# EAGLE design msx_slot_expander (EAGLE 7.6.0)

## Sheet 1 of 2
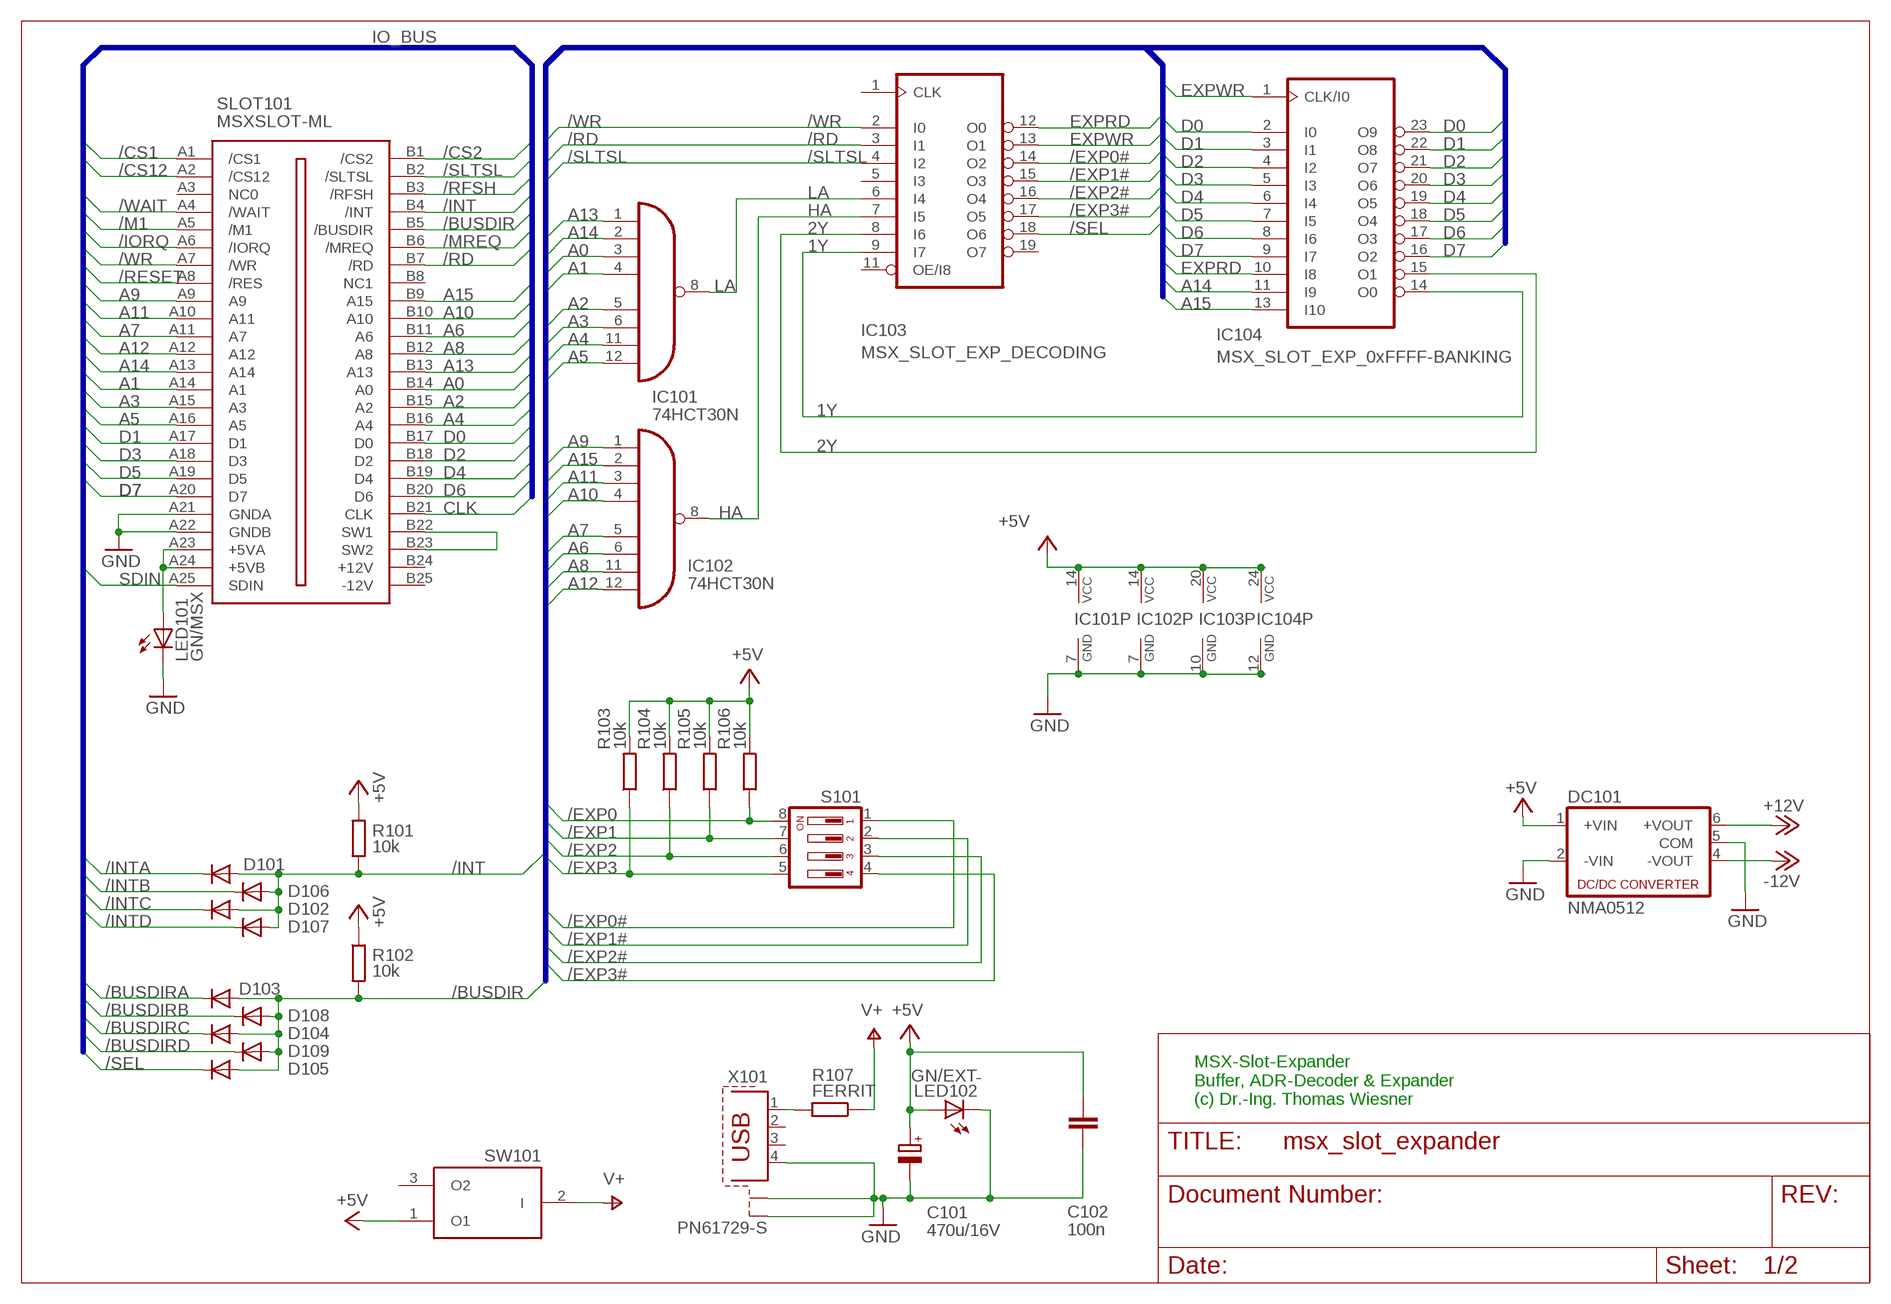
[diagram p0: schematic, sheet 1]

### Parts
C101  470u/16V  CPOL-EUE3.5-8  [E3,5-8]
C102  100n  C-EU025-025X050  [C025-025X050]
D101  1N4148  1N4148DO35-10  [DO35-10]
D102  1N4148  1N4148DO35-10  [DO35-10]
D103  1N4148  1N4148DO35-10  [DO35-10]
D104  1N4148  1N4148DO35-10  [DO35-10]
D105  1N4148  1N4148DO35-10  [DO35-10]
D106  1N4148  1N4148DO35-10  [DO35-10]
D107  1N4148  1N4148DO35-10  [DO35-10]
D108  1N4148  1N4148DO35-10  [DO35-10]
D109  1N4148  1N4148DO35-10  [DO35-10]
DC101  NMA0512  NMA  [NMA]
IC101  74HCT30N  [DIL14]
IC102  74HCT30N  [DIL14]
IC103  MSX_SLOT_EXP_DECODING  16V8  [DIL20]
IC104  MSX_SLOT_EXP_0xFFFF-BANKING  22V10  [DIL24-3]
LED101  GN/MSX  LED3MM  [LED3MM]
LED102  GN/EXT  LED3MM  [LED3MM]
R101  10k  R-EU_0207/10  [0207/10]
R102  10k  R-EU_0207/10  [0207/10]
R103  10k  R-EU_0207/10  [0207/10]
R104  10k  R-EU_0207/10  [0207/10]
R105  10k  R-EU_0207/10  [0207/10]
R106  10k  R-EU_0207/10  [0207/10]
R107  FERRIT  R-EU_0207/10  [0207/10]
S101  DA04  [DA-04]
SLOT101  MSXSLOT-ML  [MSXSLOT-ML]
SW101  TS-13PA  [TS-13-P]
X101  PN61729-S  [PN61729-S]

### Nets
1Y: IC103.9(I7) IC104.14(O0)
2Y: IC103.8(I6) IC104.15(O1)
+5V: C101.+ C102.2 DC101.1(+VIN) IC101.14(VCC) IC102.14(VCC) IC103.20(VCC) IC104.24(VCC) LED102.A R101.2 R102.1 R103.2 R104.2 R105.2 R106.2 SW101.1(O1) ; also sheet 2
+12V: DC101.6(+VOUT) ; also sheet 2
-12V: DC101.4(-VOUT) ; also sheet 2
/BUSDIR: D103.A D104.A D105.A D108.A D109.A R102.2 SLOT101.B5(/BUSDIR)
/BUSDIRA: D103.C ; also sheet 2
/BUSDIRB: D108.C ; also sheet 2
/BUSDIRC: D104.C ; also sheet 2
/BUSDIRD: D109.C ; also sheet 2
/CS1: SLOT101.A1(/CS1) ; also sheet 2
/CS2: SLOT101.B1(/CS2) ; also sheet 2
/CS12: SLOT101.A2(/CS12) ; also sheet 2
/EXP0: R106.1 S101.8 ; also sheet 2
/EXP0#: IC103.14(O2) S101.1
/EXP1: R105.1 S101.7 ; also sheet 2
/EXP1#: IC103.15(O3) S101.2
/EXP2: R104.1 S101.6 ; also sheet 2
/EXP2#: IC103.16(O4) S101.3
/EXP3: R103.1 S101.5 ; also sheet 2
/EXP3#: IC103.17(O5) S101.4
/INT: D101.A D102.A D106.A D107.A R101.1 SLOT101.B4(/INT)
/INTA: D101.C ; also sheet 2
/INTB: D106.C ; also sheet 2
/INTC: D102.C ; also sheet 2
/INTD: D107.C ; also sheet 2
/IORQ: SLOT101.A6(/IORQ) ; also sheet 2
/M1: SLOT101.A5(/M1) ; also sheet 2
/MREQ: SLOT101.B6(/MREQ) ; also sheet 2
/RD: IC103.3(I1) SLOT101.B7(/RD) ; also sheet 2
/RESET: SLOT101.A8(/RES) ; also sheet 2
/RFSH: SLOT101.B3(/RFSH) ; also sheet 2
/SEL: D105.C IC103.18(O6)
/SLTSL: IC103.4(I2) SLOT101.B2(/SLTSL)
/WAIT: SLOT101.A4(/WAIT) ; also sheet 2
/WR: IC103.2(I0) SLOT101.A7(/WR) ; also sheet 2
A0: IC101.3(I2) SLOT101.B14(A0) ; also sheet 2
A1: IC101.4(I3) SLOT101.A14(A1) ; also sheet 2
A2: IC101.5(I4) SLOT101.B15(A2) ; also sheet 2
A3: IC101.6(I5) SLOT101.A15(A3) ; also sheet 2
A4: IC101.11(I6) SLOT101.B16(A4) ; also sheet 2
A5: IC101.12(I7) SLOT101.A16(A5) ; also sheet 2
A6: IC102.6(I5) SLOT101.B11(A6) ; also sheet 2
A7: IC102.5(I4) SLOT101.A11(A7) ; also sheet 2
A8: IC102.11(I6) SLOT101.B12(A8) ; also sheet 2
A9: IC102.1(I0) SLOT101.A9 ; also sheet 2
A10: IC102.4(I3) SLOT101.B10(A10) ; also sheet 2
A11: IC102.3(I2) SLOT101.A10(A11) ; also sheet 2
A12: IC102.12(I7) SLOT101.A12 ; also sheet 2
A13: IC101.1(I0) SLOT101.B13(A13) ; also sheet 2
A14: IC101.2(I1) IC104.11(I9) SLOT101.A13(A14) ; also sheet 2
A15: IC102.2(I1) IC104.13(I10) SLOT101.B9(A15) ; also sheet 2
CLK: SLOT101.B21(CLK) ; also sheet 2
D0: IC104.2(I0) IC104.23(O9) SLOT101.B17(D0) ; also sheet 2
D1: IC104.3(I1) IC104.22(O8) SLOT101.A17(D1) ; also sheet 2
D2: IC104.4(I2) IC104.21(O7) SLOT101.B18(D2) ; also sheet 2
D3: IC104.5(I3) IC104.20(O6) SLOT101.A18(D3) ; also sheet 2
D4: IC104.6(I4) IC104.19(O5) SLOT101.B19(D4) ; also sheet 2
D5: IC104.7(I5) IC104.18(O4) SLOT101.A19(D5) ; also sheet 2
D6: IC104.8(I6) IC104.17(O3) SLOT101.B20(D6) ; also sheet 2
D7: IC104.9(I7) IC104.16(O2) SLOT101.A20(D7) ; also sheet 2
EXPRD: IC103.12(O0) IC104.10(I8)
EXPWR: IC103.13(O1) IC104.1(CLK/I0)
GND: C101.- C102.1 DC101.2(-VIN) DC101.5(COM) IC101.7(GND) IC102.7(GND) IC103.10(GND) IC104.12(GND) LED101.K(C) LED102.K(C) SLOT101.A21(GNDA) SLOT101.A22(GNDB) X101.4 X101.S1 X101.S2 ; also sheet 2
HA: IC102.8(O) IC103.7(I5)
LA: IC101.8(O) IC103.6(I4)
N$1: LED101.A SLOT101.A23(+5VA) SLOT101.A24(+5VB)
N$2: R107.2 X101.1
N$3: SLOT101.B22(SW1) SLOT101.B23(SW2)
SDIN: SLOT101.A25(SDIN) ; also sheet 2
V+: R107.1 SW101.2(I)
Unconnected: IC103.1(CLK) IC103.5(I3) IC103.11(OE/I8) IC103.19(O7) SLOT101.A3(NC0) SLOT101.B8(NC1) SLOT101.B24(+12V) SLOT101.B25(-12V) SW101.3(O2) X101.2 X101.3

### Buses
IO_BUS
B$5

### Notes on the sheet
- MSX-Slot-Expander
  Buffer, ADR-Decoder & Expander
  (c) Dr.-Ing. Thomas Wiesner

## Sheet 2 of 2
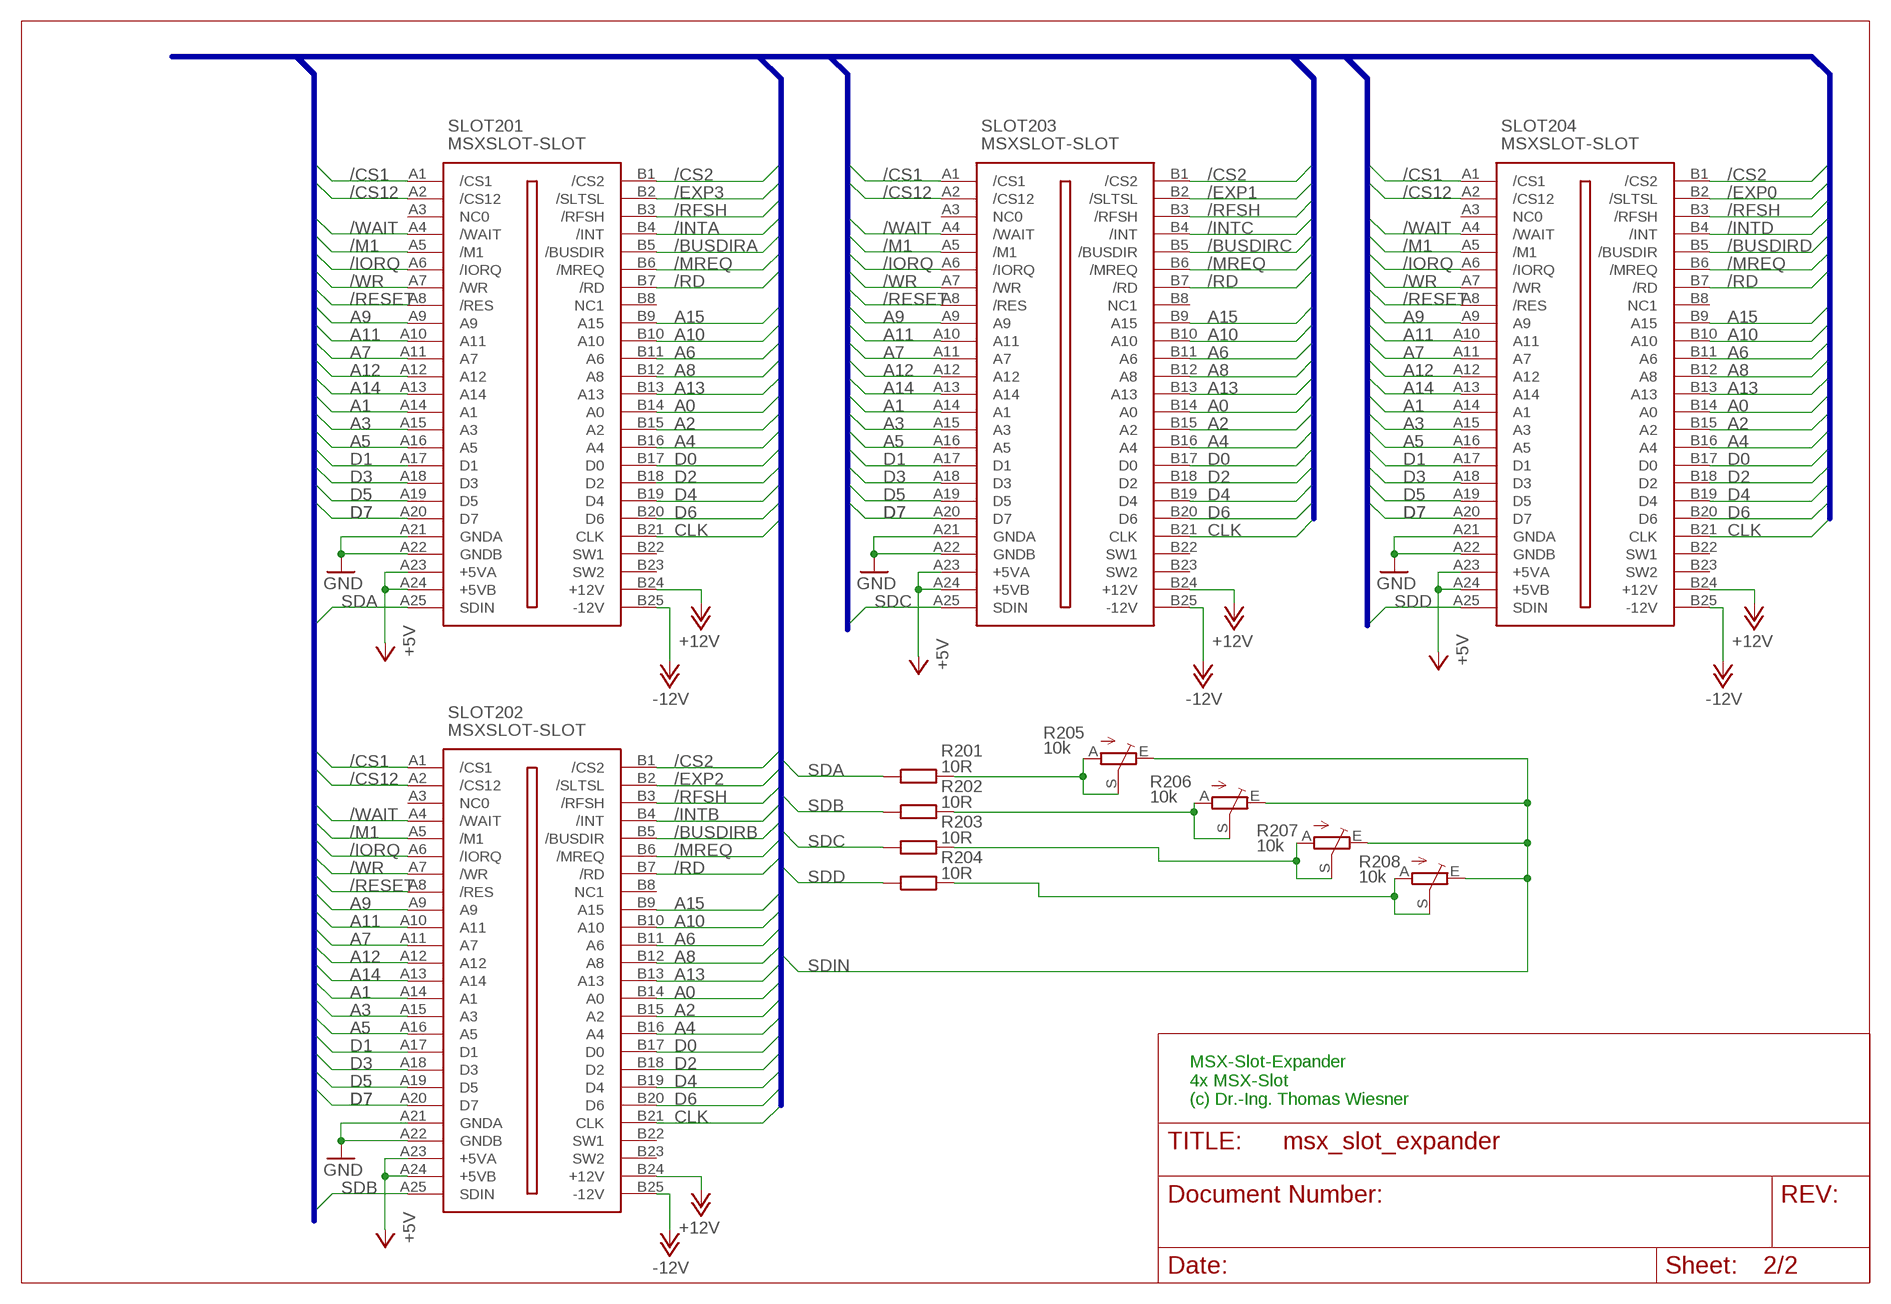
[diagram p1: schematic, sheet 2]

### Parts
R201  10R  R-EU_0207/10  [0207/10]
R202  10R  R-EU_0207/10  [0207/10]
R203  10R  R-EU_0207/10  [0207/10]
R204  10R  R-EU_0207/10  [0207/10]
R205  10k  TRIM_EU-S43P  [SP19L]
R206  10k  TRIM_EU-S43P  [SP19L]
R207  10k  TRIM_EU-S43P  [SP19L]
R208  10k  TRIM_EU-S43P  [SP19L]
SLOT201  MSXSLOT-SLOT  [MSXSLOT]
SLOT202  MSXSLOT-SLOT  [MSXSLOT]
SLOT203  MSXSLOT-SLOT  [MSXSLOT]
SLOT204  MSXSLOT-SLOT  [MSXSLOT]

### Nets
+5V: SLOT201.A23(+5VA) SLOT201.A24(+5VB) SLOT202.A23(+5VA) SLOT202.A24(+5VB) SLOT203.A23(+5VA) SLOT203.A24(+5VB) SLOT204.A23(+5VA) SLOT204.A24(+5VB) ; also sheet 1
+12V: SLOT201.B24(+12V) SLOT202.B24(+12V) SLOT203.B24(+12V) SLOT204.B24(+12V) ; also sheet 1
-12V: SLOT201.B25(-12V) SLOT202.B25(-12V) SLOT203.B25(-12V) SLOT204.B25(-12V) ; also sheet 1
/BUSDIRA: SLOT201.B5(/BUSDIR) ; also sheet 1
/BUSDIRB: SLOT202.B5(/BUSDIR) ; also sheet 1
/BUSDIRC: SLOT203.B5(/BUSDIR) ; also sheet 1
/BUSDIRD: SLOT204.B5(/BUSDIR) ; also sheet 1
/CS1: SLOT201.A1(/CS1) SLOT202.A1(/CS1) SLOT203.A1(/CS1) SLOT204.A1(/CS1) ; also sheet 1
/CS2: SLOT201.B1(/CS2) SLOT202.B1(/CS2) SLOT203.B1(/CS2) SLOT204.B1(/CS2) ; also sheet 1
/CS12: SLOT201.A2(/CS12) SLOT202.A2(/CS12) SLOT203.A2(/CS12) SLOT204.A2(/CS12) ; also sheet 1
/EXP0: SLOT204.B2(/SLTSL) ; also sheet 1
/EXP1: SLOT203.B2(/SLTSL) ; also sheet 1
/EXP2: SLOT202.B2(/SLTSL) ; also sheet 1
/EXP3: SLOT201.B2(/SLTSL) ; also sheet 1
/INTA: SLOT201.B4(/INT) ; also sheet 1
/INTB: SLOT202.B4(/INT) ; also sheet 1
/INTC: SLOT203.B4(/INT) ; also sheet 1
/INTD: SLOT204.B4(/INT) ; also sheet 1
/IORQ: SLOT201.A6(/IORQ) SLOT202.A6(/IORQ) SLOT203.A6(/IORQ) SLOT204.A6(/IORQ) ; also sheet 1
/M1: SLOT201.A5(/M1) SLOT202.A5(/M1) SLOT203.A5(/M1) SLOT204.A5(/M1) ; also sheet 1
/MREQ: SLOT201.B6(/MREQ) SLOT202.B6(/MREQ) SLOT203.B6(/MREQ) SLOT204.B6(/MREQ) ; also sheet 1
/RD: SLOT201.B7(/RD) SLOT202.B7(/RD) SLOT203.B7(/RD) SLOT204.B7(/RD) ; also sheet 1
/RESET: SLOT201.A8(/RES) SLOT202.A8(/RES) SLOT203.A8(/RES) SLOT204.A8(/RES) ; also sheet 1
/RFSH: SLOT201.B3(/RFSH) SLOT202.B3(/RFSH) SLOT203.B3(/RFSH) SLOT204.B3(/RFSH) ; also sheet 1
/WAIT: SLOT201.A4(/WAIT) SLOT202.A4(/WAIT) SLOT203.A4(/WAIT) SLOT204.A4(/WAIT) ; also sheet 1
/WR: SLOT201.A7(/WR) SLOT202.A7(/WR) SLOT203.A7(/WR) SLOT204.A7(/WR) ; also sheet 1
A0: SLOT201.B14(A0) SLOT202.B14(A0) SLOT203.B14(A0) SLOT204.B14(A0) ; also sheet 1
A1: SLOT201.A14(A1) SLOT202.A14(A1) SLOT203.A14(A1) SLOT204.A14(A1) ; also sheet 1
A2: SLOT201.B15(A2) SLOT202.B15(A2) SLOT203.B15(A2) SLOT204.B15(A2) ; also sheet 1
A3: SLOT201.A15(A3) SLOT202.A15(A3) SLOT203.A15(A3) SLOT204.A15(A3) ; also sheet 1
A4: SLOT201.B16(A4) SLOT202.B16(A4) SLOT203.B16(A4) SLOT204.B16(A4) ; also sheet 1
A5: SLOT201.A16(A5) SLOT202.A16(A5) SLOT203.A16(A5) SLOT204.A16(A5) ; also sheet 1
A6: SLOT201.B11(A6) SLOT202.B11(A6) SLOT203.B11(A6) SLOT204.B11(A6) ; also sheet 1
A7: SLOT201.A11(A7) SLOT202.A11(A7) SLOT203.A11(A7) SLOT204.A11(A7) ; also sheet 1
A8: SLOT201.B12(A8) SLOT202.B12(A8) SLOT203.B12(A8) SLOT204.B12(A8) ; also sheet 1
A9: SLOT201.A9 SLOT202.A9 SLOT203.A9 SLOT204.A9 ; also sheet 1
A10: SLOT201.B10(A10) SLOT202.B10(A10) SLOT203.B10(A10) SLOT204.B10(A10) ; also sheet 1
A11: SLOT201.A10(A11) SLOT202.A10(A11) SLOT203.A10(A11) SLOT204.A10(A11) ; also sheet 1
A12: SLOT201.A12 SLOT202.A12 SLOT203.A12 SLOT204.A12 ; also sheet 1
A13: SLOT201.B13(A13) SLOT202.B13(A13) SLOT203.B13(A13) SLOT204.B13(A13) ; also sheet 1
A14: SLOT201.A13(A14) SLOT202.A13(A14) SLOT203.A13(A14) SLOT204.A13(A14) ; also sheet 1
A15: SLOT201.B9(A15) SLOT202.B9(A15) SLOT203.B9(A15) SLOT204.B9(A15) ; also sheet 1
CLK: SLOT201.B21(CLK) SLOT202.B21(CLK) SLOT203.B21(CLK) SLOT204.B21(CLK) ; also sheet 1
D0: SLOT201.B17(D0) SLOT202.B17(D0) SLOT203.B17(D0) SLOT204.B17(D0) ; also sheet 1
D1: SLOT201.A17(D1) SLOT202.A17(D1) SLOT203.A17(D1) SLOT204.A17(D1) ; also sheet 1
D2: SLOT201.B18(D2) SLOT202.B18(D2) SLOT203.B18(D2) SLOT204.B18(D2) ; also sheet 1
D3: SLOT201.A18(D3) SLOT202.A18(D3) SLOT203.A18(D3) SLOT204.A18(D3) ; also sheet 1
D4: SLOT201.B19(D4) SLOT202.B19(D4) SLOT203.B19(D4) SLOT204.B19(D4) ; also sheet 1
D5: SLOT201.A19(D5) SLOT202.A19(D5) SLOT203.A19(D5) SLOT204.A19(D5) ; also sheet 1
D6: SLOT201.B20(D6) SLOT202.B20(D6) SLOT203.B20(D6) SLOT204.B20(D6) ; also sheet 1
D7: SLOT201.A20(D7) SLOT202.A20(D7) SLOT203.A20(D7) SLOT204.A20(D7) ; also sheet 1
GND: SLOT201.A21(GNDA) SLOT201.A22(GNDB) SLOT202.A21(GNDA) SLOT202.A22(GNDB) SLOT203.A21(GNDA) SLOT203.A22(GNDB) SLOT204.A21(GNDA) SLOT204.A22(GNDB) ; also sheet 1
N$4: R201.2 R205.A R205.S
N$9: R202.2 R206.A R206.S
N$10: R203.2 R207.A R207.S
N$15: R204.2 R208.A R208.S
SDA: R201.1 SLOT201.A25(SDIN)
SDB: R202.1 SLOT202.A25(SDIN)
SDC: R203.1 SLOT203.A25(SDIN)
SDD: R204.1 SLOT204.A25(SDIN)
SDIN: R205.E R206.E R207.E R208.E ; also sheet 1
Unconnected: SLOT201.A3(NC0) SLOT201.B8(NC1) SLOT201.B22(SW1) SLOT201.B23(SW2) SLOT202.A3(NC0) SLOT202.B8(NC1) SLOT202.B22(SW1) SLOT202.B23(SW2) SLOT203.A3(NC0) SLOT203.B8(NC1) SLOT203.B22(SW1) SLOT203.B23(SW2) SLOT204.A3(NC0) SLOT204.B8(NC1) SLOT204.B22(SW1) SLOT204.B23(SW2)

### Buses
B$5

### Notes on the sheet
- MSX-Slot-Expander
  4x MSX-Slot
  (c) Dr.-Ing. Thomas Wiesner

## Library data of the parts
C101 = rcl:CPOL-EU: POLARIZED CAPACITOR, European symbol
C102 = rcl:C-EU: CAPACITOR, European symbol
D101-D109 = diode:1N4148: DIODE high speed (Philips)
DC101 = dc-dc-converter:NMA: DC-DC CONVERTER; MF: C & D TECHNOLOGIES, INC; MPN: NMA0515SC; OC_FARNELL: 1021434; OC_NEWARK: 61K3064
IC101 IC102 = 74xx-eu:74*30: 8-input NAND gate
IC103 = pal:16V8: PAL; MPN: GAL16V8D-7LPN; OC_FARNELL: 9699740; OC_NEWARK: 97K0449
IC104 = pal:22V10: PAL; MPN: GAL22V10D-7LPN; OC_FARNELL: 1571925; OC_NEWARK: 97M0480
LED101 LED102 = led:LED: LED OSRAM: - CHIPLED LG R971, LG N971, LY N971, LG Q971, LY Q971, LO R971, LY R971 LH N974, LH R974 LS Q976, LO Q976, LY Q976 LO Q996 - Hyper CHIPLED LW Q18S LB Q993, LB Q99A, LB R99A - SideLED LS A670, LO A670, LY A670, LG A670, LP A670 LB A673, LV A673, LT A673, LW A673 LH A674 LY A675 LS A676, LA A676, LO A676, LY A676, LW A676 LS A679, LY A679, LG A679 - Hyper Micro SIDELED® LS Y876, LA Y876, LO Y876, LY Y876 LT Y87S - SmartLED LW L88C, LW L88S LB L89C, LB L89S, LG L890 LS L89K, LO L89K, LY L89K LS L896, LA L896, LO L896, LY L896 - TOPLED LS T670, LO T670, LY T670, LG T670, LP T670 LSG T670, LSP T670, LSY T670, LOP T670, LYG T670 LG T671, LOG T671, LSG T671 LB T673, LV T673, LT T673, LW T673 LH T674 LS T676, LA T676, LO T676, LY T676, LB T676, LH T676, LSB T676, LW T676 LB T67C, LV T67C, LT T67C, LS T67K, LO T67K, LY T67K, LW E67C LS E67B, LA E67B, LO E67B, LY E67B, LB E67C, LV E67C, LT E67C LW T67C LS T679, LY T679, LG T679 LS T770, LO T770, LY T770, LG T770, LP T770 LB T773, LV T773, LT T773, LW T773 LH T774 LS E675, LA E675, LY E675, LS T675 LS T776, LA T776, LO T776, LY T776, LB T776 LHGB T686 LT T68C, LB T68C - Hyper Mini TOPLED® LB M676 - Mini TOPLED Santana® LG M470 LS M47K, LO M47K, LY M47K Source: http://www.osram.convergy.de LUXEON: - LUMILED® LXK2-PW12-R00, LXK2-PW12-S00, LXK2-PW14-U00, LXK2-PW14-V00 LXK2-PM12-R00, LXK2-PM12-S00, LXK2-PM14-U00 LXK2-PE12-Q00, LXK2-PE12-R00, LXK2-PE12-S00, LXK2-PE14-T00, LXK2-PE14-U00 LXK2-PB12-K00, LXK2-PB12-L00, LXK2-PB12-M00, LXK2-PB14-N00, LXK2-PB14-P00, LXK2-PB14-Q00 LXK2-PR12-L00, LXK2-PR12-M00, LXK2-PR14-Q00, LXK2-PR14-R00 LXK2-PD12-Q00, LXK2-PD12-R00, LXK2-PD12-S00 LXK2-PH12-R00, LXK2-PH12-S00 LXK2-PL12-P00, LXK2-PL12-Q00, LXK2-PL12-R00 Source: www.luxeon.com KINGBRIGHT: KA-3528ASYC Source: www.kingbright.com
R101-R107 R201-R204 = resistor:R-EU_: RESISTOR, European symbol
R205-R208 = pot:TRIM_EU-: POTENTIOMETER
S101 = switch-dil:DA04: DIL/CODE SWITCH; MPN: MCDA04; OC_FARNELL: 9471545; OC_NEWARK: 26M1090
SLOT101 SLOT201-SLOT204 = mbc:MSXSLOT: MSX-Slot-Verbinder
SW101 = mbc:TS-13P: TS-13P - Umschalter liegend Printmontage
X101 = con-berg:PN61729-S: BERG USB connector; OC_FARNELL: unknown; OC_NEWARK: unknown

## Board
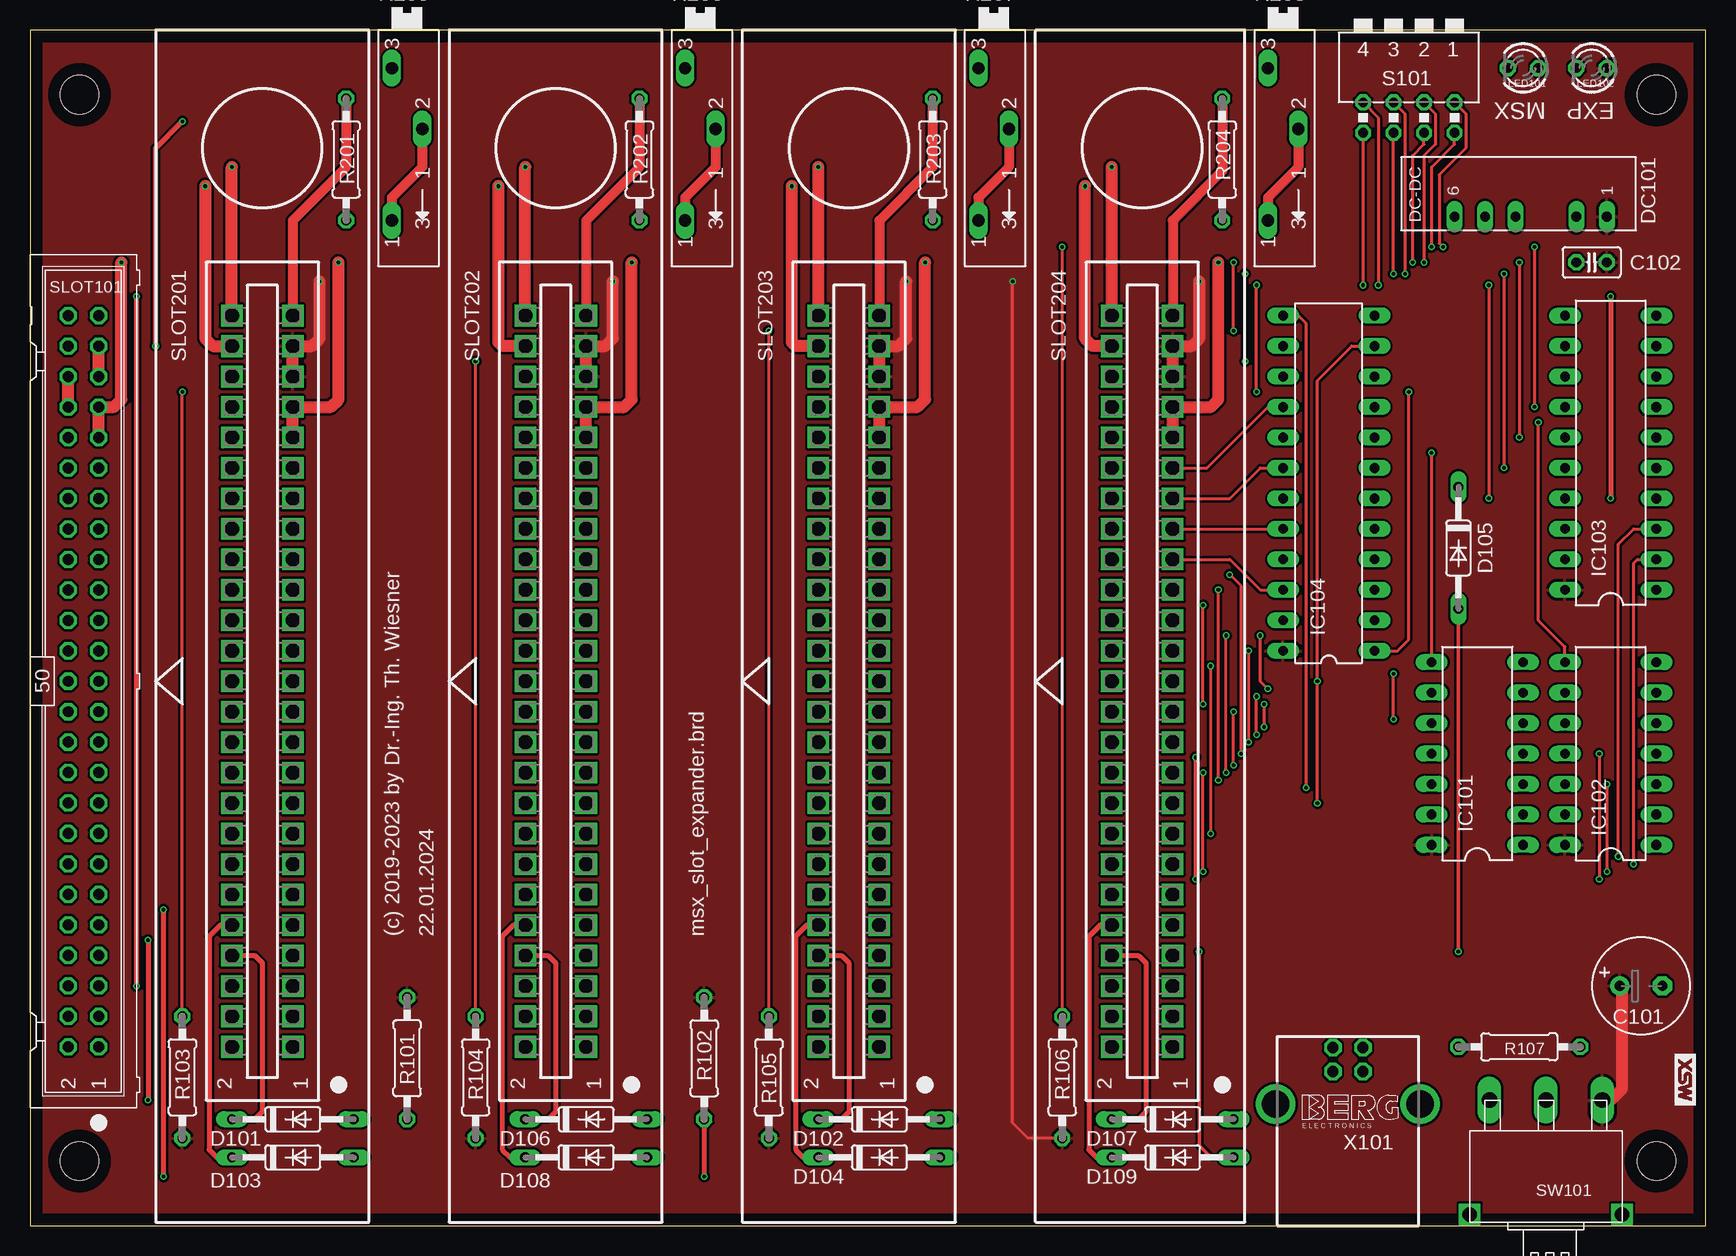
[diagram p2: board, top side]
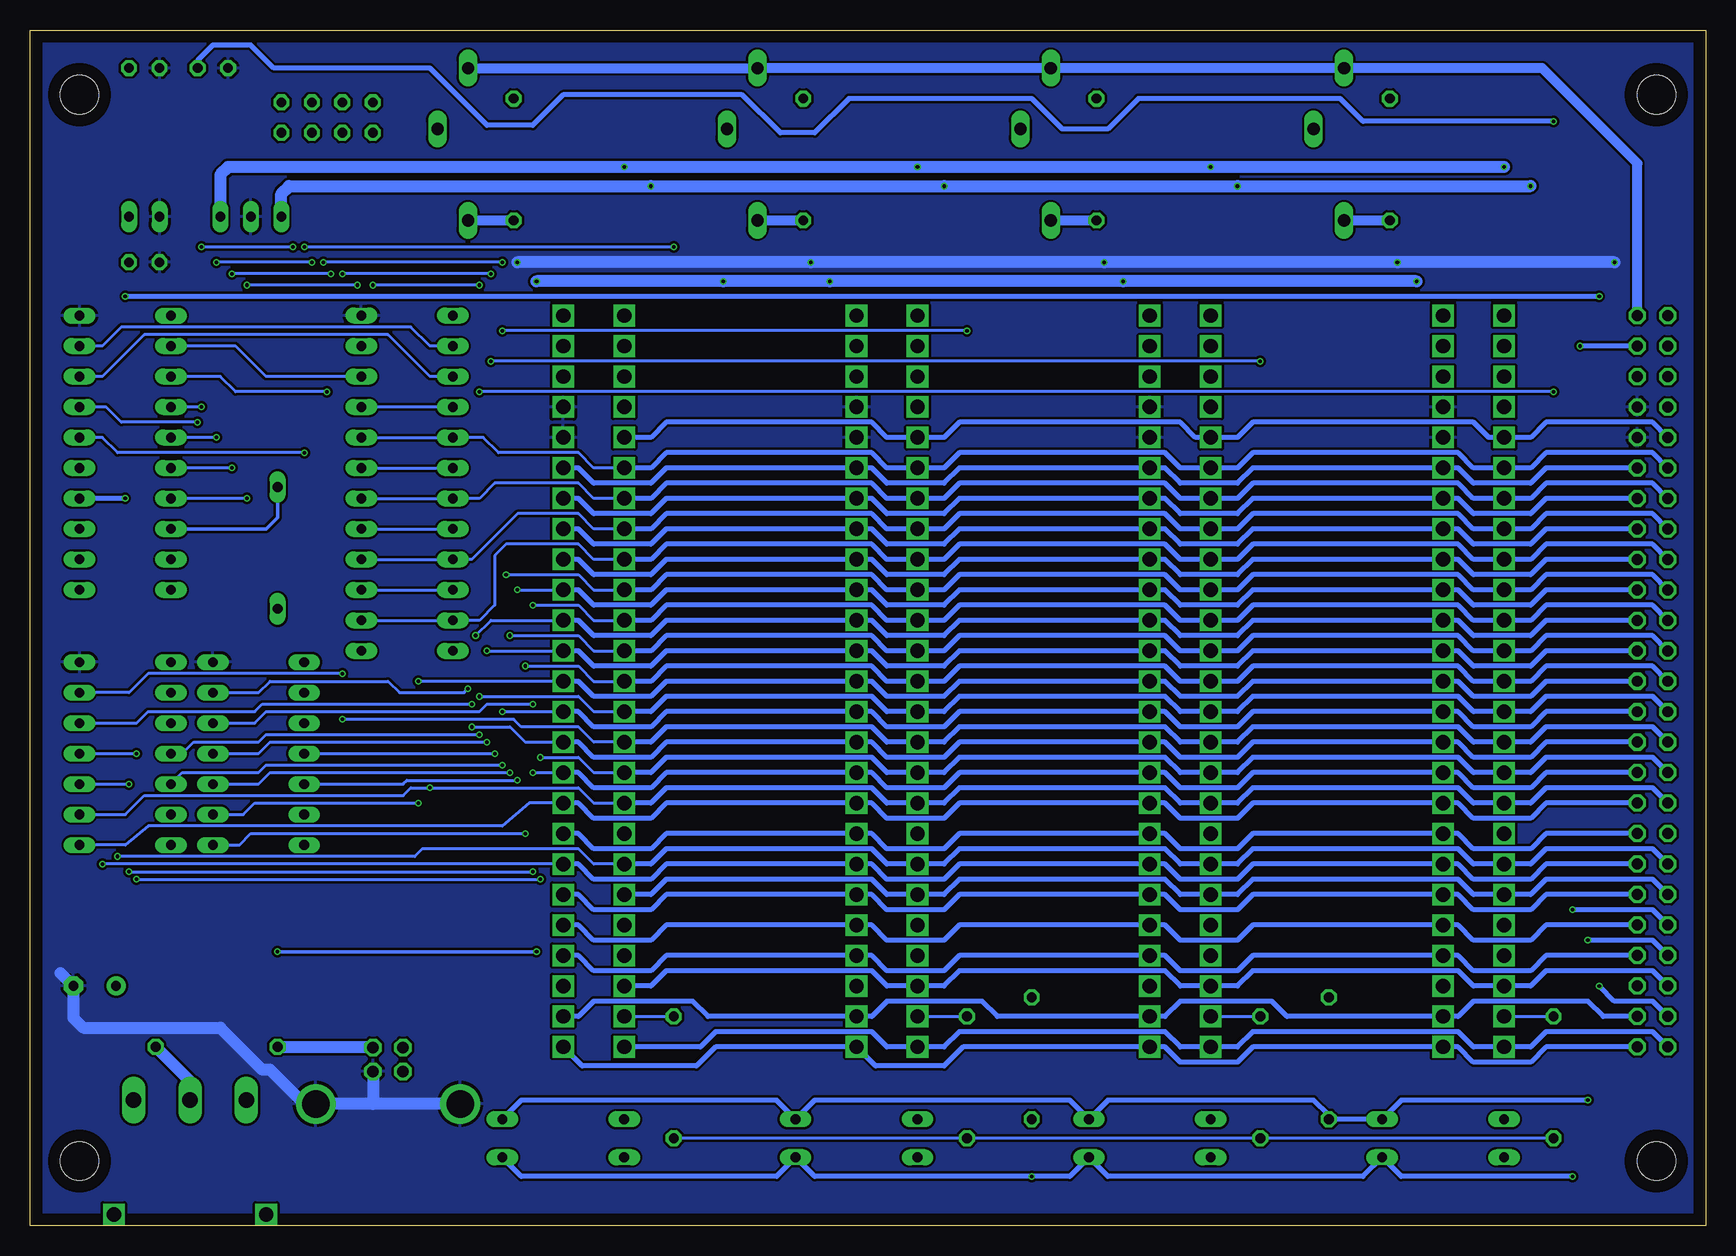
[diagram p3: board, bottom side, seen from below]

Size 139.7 x 99.69 mm. Coordinates in mm from the lower left corner, seen from the top.
Outline: 0,0 139.7,0 139.7,99.69 0,99.69 0,0
Copper layers (1*16): Top 0.035mm / dielectric 1.5mm / Bottom 0.035mm
Design rules "default *": minimum track width 10mil, minimum drill 0.3mm, track to track 8mil, track to pad 4mil, pad to pad 8mil, via to via 8mil, smd to smd 8mil, copper to edge 40mil, drill to drill 8mil, minimum pad ring 10mil, minimum via ring 0.125mm, stop-mask expansion 4mil, vias tented up to drill 0mil, thermal gap 10mil
Holes 3.2 mm at 135.57,5.4 135.57,94.3 4.13,94.3 4.13,5.4

### Footprints (pad centres in the part's own frame; a part is rotated, then mirrored left to right if it is on the bottom)
E3,5-8 = drill 0.813 pad 1.6: + -1.778,0 | drill 0.813 pad 1.6 octagon: - 1.778,0
C025-025X050 = drill 0.813 octagon: 1 -1.27,0; 2 1.27,0
DO35-10 = drill 0.813 long: A 5.08,0; C -5.08,0
NMA = drill 0.813 long: 1 0,6.35; 2 0,3.81; 4 0,-1.27; 5 0,-3.81; 6 0,-6.35
DIL14 = drill 0.813 long: 1 -7.62,-3.81; 2 -5.08,-3.81; 3 -2.54,-3.81; 4 0,-3.81; 5 2.54,-3.81; 6 5.08,-3.81; 7 7.62,-3.81; 8 7.62,3.81; 9 5.08,3.81; 10 2.54,3.81; 11 0,3.81; 12 -2.54,3.81; 13 -5.08,3.81; 14 -7.62,3.81
DIL20 = drill 0.813 long: 1 -11.43,-3.81; 2 -8.89,-3.81; 3 -6.35,-3.81; 4 -3.81,-3.81; 5 -1.27,-3.81; 6 1.27,-3.81; 7 3.81,-3.81; 8 6.35,-3.81; 9 8.89,-3.81; 10 11.43,-3.81; 11 11.43,3.81; 12 8.89,3.81; 13 6.35,3.81; 14 3.81,3.81; 15 1.27,3.81; 16 -1.27,3.81; 17 -3.81,3.81; 18 -6.35,3.81; 19 -8.89,3.81; 20 -11.43,3.81
DIL24-3 = drill 0.813 long: 1 -13.97,-3.81; 2 -11.43,-3.81; 3 -8.89,-3.81; 4 -6.35,-3.81; 5 -3.81,-3.81; 6 -1.27,-3.81; 7 1.27,-3.81; 8 3.81,-3.81; 9 6.35,-3.81; 10 8.89,-3.81; 11 11.43,-3.81; 12 13.97,-3.81; 13 13.97,3.81; 14 11.43,3.81; 15 8.89,3.81; 16 6.35,3.81; 17 3.81,3.81; 18 1.27,3.81; 19 -1.27,3.81; 20 -3.81,3.81; 21 -6.35,3.81; 22 -8.89,3.81; 23 -11.43,3.81; 24 -13.97,3.81
LED3MM = drill 0.813 octagon: A -1.27,0; K 1.27,0
0207/10 = drill 0.813 octagon: 1 -5.08,0; 2 5.08,0
SP19L = drill 1.016 long: A 5.715,-1.27; E -6.985,-1.27; S -1.905,1.27
DA-04 = drill 0.813 octagon: 1 -3.81,-1.27; 2 -1.27,-1.27; 3 1.27,-1.27; 4 3.81,-1.27; 5 3.81,1.27; 6 1.27,1.27; 7 -1.27,1.27; 8 -3.81,1.27
MSXSLOT-ML = drill 0.914 octagon: A1 30.48,1.27; A2 27.94,1.27; A3 25.4,1.27; A4 22.86,1.27; A5 20.32,1.27; A6 17.78,1.27; A7 15.24,1.27; A8 12.7,1.27; A9 10.16,1.27; A10 7.62,1.27; A11 5.08,1.27; A12 2.54,1.27; A13 0,1.27; A14 -2.54,1.27; A15 -5.08,1.27; A16 -7.62,1.27; A17 -10.16,1.27; A18 -12.7,1.27; A19 -15.24,1.27; A20 -17.78,1.27; A21 -20.32,1.27; A22 -22.86,1.27; A23 -25.4,1.27; A24 -27.94,1.27; A25 -30.48,1.27; B1 30.48,-1.27; B2 27.94,-1.27; B3 25.4,-1.27; B4 22.86,-1.27; B5 20.32,-1.27; B6 17.78,-1.27; B7 15.24,-1.27; B8 12.7,-1.27; B9 10.16,-1.27; B10 7.62,-1.27; B11 5.08,-1.27; B12 2.54,-1.27; B13 0,-1.27; B14 -2.54,-1.27; B15 -5.08,-1.27; B16 -7.62,-1.27; B17 -10.16,-1.27; B18 -12.7,-1.27; B19 -15.24,-1.27; B20 -17.78,-1.27; B21 -20.32,-1.27; B22 -22.86,-1.27; B23 -25.4,-1.27; B24 -27.94,-1.27; B25 -30.48,-1.27
MSXSLOT = drill 1.2 pad 1.778 square: A1 30.48,2.54; A2 27.94,2.54; A3 25.4,2.54; A4 22.86,2.54; A5 20.32,2.54; A6 17.78,2.54; A7 15.24,2.54; A8 12.7,2.54; A9 10.16,2.54; A10 7.62,2.54; A11 5.08,2.54; A12 2.54,2.54; A13 0,2.54; A14 -2.54,2.54; A15 -5.08,2.54; A16 -7.62,2.54; A17 -10.16,2.54; A18 -12.7,2.54; A19 -15.24,2.54; A20 -17.78,2.54; A21 -20.32,2.54; A22 -22.86,2.54; A23 -25.4,2.54; A24 -27.94,2.54; A25 -30.48,2.54; B1 30.48,-2.54; B2 27.94,-2.54; B3 25.4,-2.54; B4 22.86,-2.54; B5 20.32,-2.54; B6 17.78,-2.54; B7 15.24,-2.54; B8 12.7,-2.54; B9 10.16,-2.54; B10 7.62,-2.54; B11 5.08,-2.54; B12 2.54,-2.54; B13 0,-2.54; B14 -2.54,-2.54; B15 -5.08,-2.54; B16 -7.62,-2.54; B17 -10.16,-2.54; B18 -12.7,-2.54; B19 -15.24,-2.54; B20 -17.78,-2.54; B21 -20.32,-2.54; B22 -22.86,-2.54; B23 -25.4,-2.54; B24 -27.94,-2.54; B25 -30.48,-2.54
TS-13-P = drill 1.3 long: 1 0,-4.7; 2 0,0; 3 0,4.7 | drill 1.2 square: P$1 -9.525,-6.35; P$2 -9.525,6.35
PN61729-S = drill 0.95 octagon: 1 1.25,4.71; 2 -1.25,4.71; 3 -1.25,2.71; 4 1.25,2.71 | drill 2.3 pad 2.9: S1 -6.02,0; S2 6.02,0

### Placement (x,y rotation side)
C101  134.3,20 0 top
C102  130.18,80.33 0 top
D101  21.91,8.89 0 top
D102  70.8,8.89 0 top
D103  21.91,5.71 0 top
D104  70.8,5.71 0 top
D105  119.06,56.52 270 top
D106  46.35,8.89 0 top
D107  95.25,8.89 0 top
D108  46.35,5.71 0 top
D109  95.25,5.71 0 top
DC101  125.09,84.14 270 top
IC101  120.65,39.37 90 top
IC102  131.76,39.37 90 top
IC103  131.76,64.45 90 top
IC104  108.27,61.91 90 top
LED101  124.46,96.52 180 top
LED102  130.18,96.52 180 top
R101  31.43,13.97 90 top
R102  56.2,13.97 270 top
R103  12.7,12.38 270 top
R104  37.15,12.38 270 top
R105  61.59,12.38 270 top
R106  86.04,12.38 270 top
R107  124.14,14.92 180 top
R201  26.35,88.9 270 top
R202  50.8,88.9 270 top
R203  75.25,88.9 270 top
R204  99.38,88.9 270 top
R205  31.43,89.53 270 top
R206  55.88,89.53 270 top
R207  80.33,89.53 270 top
R208  104.46,89.53 270 top
S101  114.94,92.39 180 top
SLOT101  4.45,45.4 270 top
SLOT201  19.37,45.4 270 top
SLOT202  43.81,45.4 270 top
SLOT203  68.26,45.4 270 top
SLOT204  92.71,45.4 270 top
SW101  126.36,10.48 90 top
X101  109.86,10.16 0 top

### Tracks (layer width: path | path; a pad name or v marks a point on that pad's centre or on a via)
1Y
  Bottom 0.254: IC104.14 106.36,73.34 107.95,74.93 132.08,74.93 133.67,73.34 IC103.9
2Y
  Bottom 0.254: IC104.15 106.36,70.8 109.86,74.3 130.18,74.3 133.67,70.8 IC103.8
+5V  (via drill 0.3)
  Top 0.254: R106.2 83.19,7.3 81.92,8.57 v81.92,78.74
  Top 1.016: SLOT201.A23 SLOT201.A24 23.5,73.34 24.13,73.98 v24.13,78.74 | SLOT202.A23 SLOT202.A24 47.94,73.34 48.58,73.98 v48.58,78.74 | SLOT203.A23 SLOT203.A24 72.39,73.34 73.03,73.98 v73.03,78.74 | SLOT204.A23 SLOT204.A24 96.84,73.34 97.47,73.98 v97.47,78.74 | SW101.1 131.76,10.48 132.72,11.43 132.72,19.81 C101.+
  Bottom 0.254: R103.2 R104.2 R105.2 R106.2
  Bottom 1.016: v24.13,78.74 v48.58,78.74 v73.03,78.74 v81.92,78.74 v97.47,78.74
  pour Top: 0,99.69 0,0 139.7,0 139.7,99.69
+12V  (via drill 0.3)
  Top 1.016: v14.61,86.68 14.61,73.98 15.24,73.34 SLOT201.B24 | SLOT203.B24 63.82,73.34 63.5,73.66 v63.5,86.68 | SLOT204.B24 88.58,73.34 87.95,73.98 v87.95,86.68 | SLOT202.B24 39.37,73.34 39.05,73.66 v39.05,86.68
  Bottom 1.016: DC101.6 118.75,86.04 118.11,86.68 v87.95,86.68 v63.5,86.68 v39.05,86.68 v14.61,86.68
-12V  (via drill 0.3)
  Top 1.016: SLOT204.B25 v90.17,88.27 | SLOT201.B25 v16.83,88.27 | SLOT202.B25 v41.27,88.27 | SLOT203.B25 v65.72,88.27
  Bottom 1.016: DC101.4 123.83,87.63 123.19,88.27 v90.17,88.27 v65.72,88.27 v41.27,88.27 v16.83,88.27
/BUSDIR  (via drill 0.3)
  Top 0.305: D105.A v119.06,22.86 | v97.47,22.86 97.47,6.67 98.42,5.71 D109.A
  Top 0.406: v11.11,26.35 v11.11,4.13 | R102.2 v56.2,4.13
  Bottom 0.305: v119.06,22.86 v97.47,22.86
  Bottom 0.406: SLOT101.B5 4.45,26.35 v11.11,26.35 | v11.11,4.13 25.4,4.13 D103.A 28.57,4.13 49.85,4.13 D108.A 53.02,4.13 v56.2,4.13 74.3,4.13 D104.A 77.47,4.13 98.74,4.13 D109.A
/BUSDIRA
  Top 0.406: SLOT201.B5 15.88,25.08 14.92,24.13 14.92,6.35 15.56,5.71 D103.C
/BUSDIRB
  Top 0.406: SLOT202.B5 40.32,25.08 39.37,24.13 39.37,6.35 40.01,5.71 D108.C
/BUSDIRC
  Top 0.406: SLOT203.B5 64.77,25.08 63.82,24.13 63.82,6.35 64.45,5.71 D104.C
/BUSDIRD
  Top 0.406: SLOT204.B5 89.22,25.08 88.27,24.13 88.27,6.35 88.9,5.71 D109.C
/CS1
  Bottom 0.406: SLOT101.A1 13.34,14.92 14.61,13.65 19.37,13.65 20.64,14.92 SLOT201.A1 37.78,14.92 39.05,13.65 43.81,13.65 45.09,14.92 SLOT202.A1 61.91,14.92 63.5,13.34 69.22,13.34 SLOT203.A1 82.55,14.92 84.14,13.34 93.66,13.34 SLOT204.A1
/CS2
  Bottom 0.406: SLOT101.B1 4.45,16.19 13.34,16.19 14.61,14.92 SLOT201.B1 19.37,14.92 20.64,16.19 37.78,16.19 39.05,14.92 SLOT202.B1 43.81,14.92 45.09,16.19 62.23,16.19 63.5,14.92 SLOT203.B1 68.26,14.92 69.53,16.19 82.55,16.19 83.82,14.92 SLOT204.B1
/CS12
  Bottom 0.406: SLOT101.A2 8.57,17.46 9.84,18.73 19.37,18.73 20.64,17.46 SLOT201.A2 34.92,17.46 36.2,18.73 43.81,18.73 45.09,17.46 SLOT202.A2 59.05,17.46 60.33,18.73 68.26,18.73 69.53,17.46 SLOT203.A2 83.19,17.46 84.45,18.73 92.71,18.73 93.98,17.46 SLOT204.A2
/EXP0  (via drill 0.3)
  Top 0.254: R106.1 v86.04,81.6 | v116.84,81.6 116.84,88.27 118.75,90.17 S101.8
  Bottom 0.254: SLOT204.B2 R106.1 | v86.04,81.6 v116.84,81.6
/EXP0#  (via drill 0.3)
  Top 0.254: S101.1 119.7,92.71 119.7,89.85 117.47,87.63 117.47,81.92 v117.79,81.6 | v125.41,81.6 v125.41,68.26
  Bottom 0.254: v117.79,81.6 v125.41,81.6 | v125.41,68.26 IC103.14
/EXP1  (via drill 0.3)
  Top 0.254: R105.1 v61.59,74.61 | v100.33,74.61 v100.33,80.33 | v115.25,80.33 115.25,89.22 116.2,90.17 S101.7
  Bottom 0.254: SLOT203.B2 R105.1 | v61.59,74.61 v100.33,74.61 | v100.33,80.33 v115.25,80.33
/EXP1#  (via drill 0.3)
  Top 0.254: S101.2 117.16,92.71 117.16,90.17 116.2,89.22 v116.2,80.33 | v124.14,80.33 v124.14,65.72
  Bottom 0.254: v116.2,80.33 v124.14,80.33 | v124.14,65.72 IC103.15
/EXP2  (via drill 0.3)
  Top 0.254: R104.1 v37.15,72.07 | v101.28,72.07 v101.28,79.38 | v113.67,79.38 S101.6
  Bottom 0.254: SLOT202.B2 R104.1 | v37.15,72.07 v101.28,72.07 | v101.28,79.38 v113.67,79.38
/EXP2#  (via drill 0.3)
  Top 0.254: S101.3 114.62,92.71 v114.62,79.38 | v122.87,79.38 v122.87,63.18
  Bottom 0.254: v114.62,79.38 v122.87,79.38 | v122.87,63.18 IC103.16
/EXP3  (via drill 0.3)
  Top 0.254: R103.1 v12.7,69.53 | v102.23,69.53 v102.23,78.42 | v111.12,78.42 S101.5
  Bottom 0.254: SLOT201.B2 R103.1 | v12.7,69.53 v102.23,69.53 | v102.23,78.42 v111.12,78.42
/EXP3#  (via drill 0.3)
  Top 0.254: S101.4 112.39,92.39 v112.39,78.42 | v121.6,78.42 v121.6,60.64
  Bottom 0.254: v112.39,78.42 v121.6,78.42 | v121.6,60.64 IC103.17
/INT  (via drill 0.3)
  Top 0.406: v9.84,23.81 v9.84,10.48
  Bottom 0.406: D107.A 98.74,10.48 77.47,10.48 D102.A 74.3,10.48 53.02,10.48 D106.A 49.85,10.48 32.7,10.48 31.43,9.21 R101.1 D101.A 25.4,10.48 v9.84,10.48 | SLOT101.B4 4.45,23.81 v9.84,23.81
/INTA
  Top 0.406: SLOT201.B4 18.73,22.54 19.37,21.91 19.37,9.53 18.73,8.89 D101.C
/INTB
  Top 0.406: SLOT202.B4 43.18,22.54 43.81,21.91 43.81,9.53 43.18,8.89 D106.C
/INTC
  Top 0.406: SLOT203.B4 67.63,22.54 68.26,21.91 68.26,9.53 67.63,8.89 D102.C
/INTD
  Top 0.406: SLOT204.B4 92.39,22.54 93.03,21.91 93.03,9.53 92.39,8.89 D107.C
/IORQ
  Bottom 0.406: SLOT101.A6 13.34,27.62 14.61,26.35 19.37,26.35 20.64,27.62 SLOT201.A6 37.78,27.62 39.05,26.35 43.81,26.35 45.09,27.62 SLOT202.A6 62.23,27.62 63.5,26.35 68.26,26.35 69.53,27.62 SLOT203.A6 86.68,27.62 87.95,26.35 92.71,26.35 93.98,27.62 SLOT204.A6
/M1
  Bottom 0.406: SLOT101.A5 13.34,25.08 14.61,23.81 19.37,23.81 20.64,25.08 SLOT201.A5 37.78,25.08 39.05,23.81 43.81,23.81 45.09,25.08 SLOT202.A5 62.23,25.08 63.5,23.81 68.26,23.81 69.53,25.08 SLOT203.A5 86.68,25.08 87.95,23.81 92.71,23.81 93.98,25.08 SLOT204.A5
/MREQ
  Bottom 0.406: SLOT101.B6 4.45,28.89 13.34,28.89 14.61,27.62 SLOT201.B6 19.37,27.62 20.64,28.89 37.78,28.89 39.05,27.62 SLOT202.B6 43.81,27.62 45.09,28.89 62.23,28.89 63.5,27.62 SLOT203.B6 68.26,27.62 69.53,28.89 86.68,28.89 87.95,27.62 SLOT204.B6
/RD  (via drill 0.3)
  Top 0.254: v132.4,30.8 132.4,56.83 133.67,58.1 IC103.3
  Bottom 0.254: SLOT204.B7 92.71,30.16 93.98,31.43 107,31.43 107.63,30.8 v132.4,30.8
  Bottom 0.406: SLOT101.B7 4.45,31.43 13.34,31.43 14.61,30.16 SLOT201.B7 19.37,30.16 20.64,31.43 37.78,31.43 39.05,30.16 SLOT202.B7 43.81,30.16 45.09,31.43 62.23,31.43 63.5,30.16 SLOT203.B7 68.26,30.16 69.53,31.43 86.68,31.43 87.95,30.16 SLOT204.B7
/RESET
  Bottom 0.406: SLOT101.A8 13.34,32.7 14.61,31.43 19.37,31.43 20.64,32.7 SLOT201.A8 37.78,32.7 39.05,31.43 43.81,31.43 45.09,32.7 SLOT202.A8 62.23,32.7 63.5,31.43 68.26,31.43 69.53,32.7 SLOT203.A8 86.68,32.7 87.95,31.43 92.71,31.43 93.98,32.7 SLOT204.A8
/RFSH
  Bottom 0.406: SLOT101.B3 4.45,21.27 13.34,21.27 14.61,20 SLOT201.B3 19.37,20 20.64,21.27 37.78,21.27 39.05,20 SLOT202.B3 43.81,20 45.09,21.27 62.23,21.27 63.5,20 SLOT203.B3 68.26,20 69.53,21.27 86.68,21.27 87.95,20 SLOT204.B3
/SEL
  Bottom 0.305: IC103.18 120.02,58.1 119.06,59.05 D105.C
/SLTSL  (via drill 0.3)
  Top 0.406: v8.89,20 v8.89,77.47 | v131.76,77.47 v131.76,60.64
  Bottom 0.406: SLOT101.B2 4.45,18.73 7.62,18.73 v8.89,20 | v8.89,77.47 v131.76,77.47 | v131.76,60.64 IC103.4
/WAIT
  Bottom 0.406: SLOT101.A4 13.34,22.54 14.61,21.27 19.37,21.27 20.64,22.54 SLOT201.A4 37.78,22.54 39.05,21.27 43.81,21.27 45.09,22.54 SLOT202.A4 62.23,22.54 63.5,21.27 68.26,21.27 69.53,22.54 SLOT203.A4 86.68,22.54 87.95,21.27 92.71,21.27 93.98,22.54 SLOT204.A4
/WR  (via drill 0.3)
  Top 0.254: v133.67,30.16 133.67,55.24 133.99,55.56 IC103.2
  Bottom 0.254: SLOT204.A7 v133.67,30.16
  Bottom 0.406: SLOT101.A7 13.34,30.16 14.61,28.89 19.37,28.89 20.64,30.16 SLOT201.A7 37.78,30.16 39.05,28.89 43.81,28.89 45.09,30.16 SLOT202.A7 62.23,30.16 63.5,28.89 68.26,28.89 69.53,30.16 SLOT203.A7 86.68,30.16 87.95,28.89 92.71,28.89 93.98,30.16 SLOT204.A7
A0  (via drill 0.3)
  Top 0.254: v99.69,37.78 v99.69,49.21
  Bottom 0.254: IC101.3 120.65,36.83 119.7,37.78 v99.69,37.78 | v99.69,49.21 93.98,49.21 92.71,47.94 SLOT204.B14
  Bottom 0.406: SLOT101.B14 4.45,49.21 13.34,49.21 14.61,47.94 SLOT201.B14 19.37,47.94 20.64,49.21 37.78,49.21 39.05,47.94 SLOT202.B14 43.81,47.94 45.09,49.21 62.23,49.21 63.5,47.94 SLOT203.B14 68.26,47.94 69.53,49.21 86.68,49.21 87.95,47.94 SLOT204.B14
A1  (via drill 0.3)
  Top 0.254: v101.6,40.32 v101.6,47.94
  Bottom 0.254: IC101.4 120.65,39.37 119.7,40.32 v101.6,40.32 | v101.6,47.94 SLOT204.A14
  Bottom 0.406: SLOT101.A14 13.34,47.94 14.61,46.67 19.37,46.67 20.64,47.94 SLOT201.A14 37.78,47.94 39.05,46.67 43.81,46.67 45.09,47.94 SLOT202.A14 62.23,47.94 63.5,46.67 68.26,46.67 69.53,47.94 SLOT203.A14 86.68,47.94 87.95,46.67 92.71,46.67 93.98,47.94 SLOT204.A14
A2  (via drill 0.3)
  Top 0.254: v97.79,43.5 v97.79,51.75
  Bottom 0.254: IC101.5 120.97,41.91 120.02,42.86 102.23,42.86 101.6,43.5 v97.79,43.5 | v97.79,51.75 93.98,51.75 92.71,50.48 SLOT204.B15
  Bottom 0.406: SLOT101.B15 4.45,51.75 13.34,51.75 14.61,50.48 SLOT201.B15 19.37,50.48 20.64,51.75 37.78,51.75 39.05,50.48 SLOT202.B15 43.81,50.48 45.09,51.75 62.23,51.75 63.5,50.48 SLOT203.B15 68.26,50.48 69.53,51.75 86.68,51.75 87.95,50.48 SLOT204.B15
A3  (via drill 0.3)
  Top 0.254: v103.19,44.77 102.55,45.4 v102.55,49.21
  Bottom 0.254: IC101.6 120.65,44.45 119.7,45.4 109.86,45.4 108.9,44.45 103.5,44.45 v103.19,44.77 | v102.55,49.21 101.28,50.48 SLOT204.A15
  Bottom 0.406: SLOT101.A15 13.34,50.48 14.61,49.21 19.37,49.21 20.64,50.48 SLOT201.A15 37.78,50.48 39.05,49.21 43.81,49.21 45.09,50.48 SLOT202.A15 62.23,50.48 63.5,49.21 68.26,49.21 69.53,50.48 SLOT203.A15 86.68,50.48 87.95,49.21 92.71,49.21 93.98,50.48 SLOT204.A15
A4  (via drill 0.3)
  Top 0.254: v100.97,39.37 100.97,53.34 v100.01,54.29
  Bottom 0.254: IC101.11 v100.97,39.37 | v100.01,54.29 93.98,54.29 92.71,53.02 SLOT204.B16
  Bottom 0.406: SLOT101.B16 4.45,54.29 13.34,54.29 14.61,53.02 SLOT201.B16 19.37,53.02 20.64,54.29 37.78,54.29 39.05,53.02 SLOT202.B16 43.81,53.02 45.09,54.29 62.23,54.29 63.5,53.02 SLOT203.B16 68.26,53.02 69.53,54.29 86.68,54.29 87.95,53.02 SLOT204.B16
A5  (via drill 0.3)
  Top 0.254: v99.06,37.15 v99.06,53.02
  Bottom 0.254: IC101.12 108.58,36.83 108.27,37.15 v99.06,37.15 | v99.06,53.02 SLOT204.A16
  Bottom 0.406: SLOT101.A16 13.34,53.02 14.61,51.75 19.37,51.75 20.64,53.02 SLOT201.A16 37.78,53.02 39.05,51.75 43.81,51.75 45.09,53.02 SLOT202.A16 62.23,53.02 63.5,51.75 68.26,51.75 69.53,53.02 SLOT203.A16 86.68,53.02 87.95,51.75 92.71,51.75 93.98,53.02 SLOT204.A16
A6  (via drill 0.3)
  Top 0.254: v113.67,42.23 v113.67,46.04
  Bottom 0.254: SLOT204.B11 92.71,40.32 93.98,41.59 98.74,41.59 99.38,42.23 v113.67,42.23 | v113.67,46.04 129.86,46.04 131.44,44.45 IC102.6
  Bottom 0.406: SLOT101.B11 4.45,41.59 13.34,41.59 14.61,40.32 SLOT201.B11 19.37,40.32 20.64,41.59 37.78,41.59 39.05,40.32 SLOT202.B11 43.81,40.32 45.09,41.59 62.23,41.59 63.5,40.32 SLOT203.B11 68.26,40.32 69.53,41.59 86.68,41.59 87.95,40.32 SLOT204.B11
A7  (via drill 0.3)
  Top 0.254: v102.87,43.5 v102.87,41.59
  Bottom 0.254: IC102.5 130.81,41.91 129.86,42.86 120.97,42.86 120.33,43.5 v102.87,43.5 | v102.87,41.59 99.69,41.59 98.42,40.32 SLOT204.A11
  Bottom 0.406: SLOT101.A11 13.34,40.32 14.61,39.05 19.37,39.05 20.64,40.32 SLOT201.A11 37.78,40.32 39.05,39.05 43.81,39.05 45.09,40.32 SLOT202.A11 62.23,40.32 63.5,39.05 68.26,39.05 69.53,40.32 SLOT203.A11 86.68,40.32 87.95,39.05 92.71,39.05 93.98,40.32 SLOT204.A11
A8  (via drill 0.3)
  Top 0.254: v102.23,40.96 v102.23,44.13
  Bottom 0.254: IC102.11 127,39.37 126.05,40.32 120.65,40.32 120.02,40.96 v102.23,40.96 | v102.23,44.13 93.98,44.13 92.71,42.86 SLOT204.B12
  Bottom 0.406: SLOT101.B12 4.45,44.13 13.34,44.13 14.61,42.86 SLOT201.B12 19.37,42.86 20.64,44.13 37.78,44.13 39.05,42.86 SLOT202.B12 43.81,42.86 45.09,44.13 62.23,44.13 63.5,42.86 SLOT203.B12 68.26,42.86 69.53,44.13 86.68,44.13 87.95,42.86 SLOT204.B12
A9
  Bottom 0.254: SLOT204.A9 98.11,35.24 100.33,33.34 129.86,33.34 131.76,31.75 IC102.1
  Bottom 0.406: SLOT101.A9 13.34,35.24 14.61,33.97 19.37,33.97 20.64,35.24 SLOT201.A9 37.78,35.24 39.05,33.97 43.81,33.97 45.09,35.24 SLOT202.A9 62.23,35.24 63.5,33.97 68.26,33.97 69.53,35.24 SLOT203.A9 86.68,35.24 87.95,33.97 92.71,33.97 93.98,35.24 SLOT204.A9
A10  (via drill 0.3)
  Top 0.254: v130.81,39.37 v130.81,28.89 | v97.16,28.89 v97.16,39.05
  Bottom 0.254: IC102.4 v130.81,39.37 | v130.81,28.89 v97.16,28.89 | v97.16,39.05 93.98,39.05 92.71,37.78 SLOT204.B10
  Bottom 0.406: SLOT101.B10 4.45,39.05 13.34,39.05 14.61,37.78 SLOT201.B10 19.37,37.78 20.64,39.05 37.78,39.05 39.05,37.78 SLOT202.B10 43.81,37.78 45.09,39.05 62.23,39.05 63.5,37.78 SLOT203.B10 68.26,37.78 69.53,39.05 86.68,39.05 87.95,37.78 SLOT204.B10
A11  (via drill 0.3)
  Top 0.254: v131.44,36.83 v131.44,29.53 | v97.79,29.53 v97.79,37.78
  Bottom 0.254: IC102.3 v131.44,36.83 | v131.44,29.53 v97.79,29.53 | v97.79,37.78 SLOT204.A10
  Bottom 0.406: SLOT101.A10 13.34,37.78 14.61,36.51 19.37,36.51 20.64,37.78 SLOT201.A10 37.78,37.78 39.05,36.51 43.81,36.51 45.09,37.78 SLOT202.A10 62.23,37.78 63.5,36.51 68.26,36.51 69.53,37.78 SLOT203.A10 86.68,37.78 87.95,36.51 92.71,36.51 93.98,37.78 SLOT204.A10
A12  (via drill 0.3)
  Top 0.254: v100.33,38.42 v100.33,42.86
  Bottom 0.254: IC102.12 127,37.78 120.65,37.78 120.02,38.42 v100.33,38.42 | v100.33,42.86 SLOT204.A12
  Bottom 0.406: SLOT101.A12 13.34,42.86 14.61,41.59 19.37,41.59 20.64,42.86 SLOT201.A12 37.78,42.86 39.05,41.59 43.81,41.59 45.09,42.86 SLOT202.A12 62.23,42.86 63.5,41.59 68.26,41.59 69.53,42.86 SLOT203.A12 86.68,42.86 87.95,41.59 92.71,41.59 93.98,42.86 SLOT204.A12
A13  (via drill 0.3)
  Top 0.254: v98.42,32.7 v98.42,46.67
  Bottom 0.254: IC101.1 122.24,31.75 121.28,32.7 v98.42,32.7 | v98.42,46.67 93.98,46.67 92.71,45.4 SLOT204.B13
  Bottom 0.406: SLOT101.B13 4.45,46.67 13.34,46.67 14.61,45.4 SLOT201.B13 19.37,45.4 20.64,46.67 37.78,46.67 39.05,45.4 SLOT202.B13 43.81,45.4 45.09,46.67 62.23,46.67 63.5,45.4 SLOT203.B13 68.26,45.4 69.53,46.67 86.68,46.67 87.95,45.4 SLOT204.B13
A14  (via drill 0.3)
  Top 0.254: IC104.11 110.17,73.34 107.31,70.48 v107.31,45.4 v107.31,35.24
  Bottom 0.254: SLOT204.A13 v107.31,45.4 | IC101.2 121.92,34.29 120.97,35.24 v107.31,35.24
  Bottom 0.406: SLOT101.A13 13.34,45.4 14.61,44.13 19.37,44.13 20.64,45.4 SLOT201.A13 37.78,45.4 39.05,44.13 43.81,44.13 45.09,45.4 SLOT202.A13 62.23,45.4 63.5,44.13 68.26,44.13 69.53,45.4 SLOT203.A13 86.68,45.4 87.95,44.13 92.71,44.13 93.98,45.4 SLOT204.A13
A15  (via drill 0.3)
  Top 0.254: IC104.13 105.73,75.88 106.36,75.25 v106.36,36.51
  Bottom 0.254: SLOT204.B9 92.71,35.24 93.98,36.51 v106.36,36.51 107.95,36.51 108.58,35.88 130.18,35.88 131.76,34.29 IC102.2
  Bottom 0.406: SLOT101.B9 4.45,36.51 13.34,36.51 14.61,35.24 SLOT201.B9 19.37,35.24 20.64,36.51 37.78,36.51 39.05,35.24 SLOT202.B9 43.81,35.24 45.09,36.51 62.23,36.51 63.5,35.24 SLOT203.B9 68.26,35.24 69.53,36.51 86.68,36.51 87.95,35.24 SLOT204.B9
CLK
  Bottom 0.406: SLOT101.B21 4.45,66.99 13.34,66.99 14.61,65.72 SLOT201.B21 18.1,65.72 19.37,66.99 37.78,66.99 39.05,65.72 SLOT202.B21 42.55,65.72 43.81,66.99 62.23,66.99 63.5,65.72 SLOT203.B21 68.26,65.72 69.53,66.99 86.68,66.99 87.95,65.72 SLOT204.B21
D0
  Bottom 0.254: IC104.2 IC104.23 102.23,50.48 100.97,51.75 100.97,55.88 100.01,56.83 93.98,56.83 92.71,55.56 SLOT204.B17
  Bottom 0.406: SLOT101.B17 4.45,56.83 13.34,56.83 14.61,55.56 SLOT201.B17 19.37,55.56 20.64,56.83 37.78,56.83 39.05,55.56 SLOT202.B17 43.81,55.56 45.09,56.83 62.23,56.83 63.5,55.56 SLOT203.B17 68.26,55.56 69.53,56.83 86.68,56.83 87.95,55.56 SLOT204.B17
D1
  Top 0.254: SLOT204.A17 100.01,55.56 102.55,53.02 IC104.22
  Bottom 0.254: IC104.3 IC104.22
  Bottom 0.406: SLOT101.A17 13.34,55.56 14.61,54.29 19.37,54.29 20.64,55.56 SLOT201.A17 37.78,55.56 39.05,54.29 43.81,54.29 45.09,55.56 SLOT202.A17 62.23,55.56 63.5,54.29 68.26,54.29 69.53,55.56 SLOT203.A17 86.68,55.56 87.95,54.29 92.71,54.29 93.98,55.56 SLOT204.A17
D2
  Bottom 0.254: IC104.4 IC104.21 102.87,55.56 99.06,59.37 93.98,59.37 92.71,58.1 SLOT204.B18
  Bottom 0.406: SLOT101.B18 4.45,59.37 13.34,59.37 14.61,58.1 SLOT201.B18 19.37,58.1 20.64,59.37 37.78,59.37 39.05,58.1 SLOT202.B18 43.81,58.1 45.09,59.37 62.23,59.37 63.5,58.1 SLOT203.B18 68.26,58.1 69.53,59.37 86.68,59.37 87.95,58.1 SLOT204.B18
D3
  Top 0.254: SLOT204.A18 IC104.20
  Bottom 0.254: IC104.5 IC104.20
  Bottom 0.406: SLOT101.A18 13.34,58.1 14.61,56.83 19.37,56.83 20.64,58.1 SLOT201.A18 37.78,58.1 39.05,56.83 43.81,56.83 45.09,58.1 SLOT202.A18 62.23,58.1 63.5,56.83 68.26,56.83 69.53,58.1 SLOT203.A18 86.68,58.1 87.95,56.83 92.71,56.83 93.98,58.1 SLOT204.A18
D4
  Bottom 0.254: IC104.6 IC104.19 102.23,60.64 100.97,61.91 93.98,61.91 92.71,60.64 SLOT204.B19
  Bottom 0.406: SLOT101.B19 4.45,61.91 13.34,61.91 14.61,60.64 SLOT201.B19 19.37,60.64 20.64,61.91 37.78,61.91 39.05,60.64 SLOT202.B19 43.81,60.64 45.09,61.91 62.23,61.91 63.5,60.64 SLOT203.B19 68.26,60.64 69.53,61.91 86.68,61.91 87.95,60.64 SLOT204.B19
D5
  Top 0.254: SLOT204.A19 100.01,60.64 102.55,63.18 IC104.18
  Bottom 0.254: IC104.7 IC104.18
  Bottom 0.406: SLOT101.A19 13.34,60.64 14.61,59.37 19.37,59.37 20.64,60.64 SLOT201.A19 37.78,60.64 39.05,59.37 43.81,59.37 45.09,60.64 SLOT202.A19 62.23,60.64 63.5,59.37 68.26,59.37 69.53,60.64 SLOT203.A19 86.68,60.64 87.95,59.37 92.71,59.37 93.98,60.64 SLOT204.A19
D6
  Bottom 0.254: IC104.8 IC104.17 101.92,65.72 100.65,64.45 93.98,64.45 92.71,63.18 SLOT204.B20
  Bottom 0.406: SLOT101.B20 4.45,64.45 13.34,64.45 14.61,63.18 SLOT201.B20 19.37,63.18 20.64,64.45 37.78,64.45 39.05,63.18 SLOT202.B20 43.81,63.18 45.09,64.45 62.23,64.45 63.5,63.18 SLOT203.B20 68.26,63.18 69.53,64.45 86.68,64.45 87.95,63.18 SLOT204.B20
D7
  Top 0.254: SLOT204.A20 98.11,63.18 103.19,68.26 IC104.16
  Bottom 0.254: IC104.16 IC104.9
  Bottom 0.406: SLOT101.A20 13.34,63.18 14.61,61.91 19.37,61.91 20.64,63.18 SLOT201.A20 37.78,63.18 39.05,61.91 43.81,61.91 45.09,63.18 SLOT202.A20 62.23,63.18 63.5,61.91 68.26,61.91 69.53,63.18 SLOT203.A20 86.68,63.18 87.95,61.91 92.71,61.91 93.98,63.18 SLOT204.A20
EXPRD
  Bottom 0.254: IC104.10 120.02,70.8 122.56,73.34 IC103.12
EXPWR  (via drill 0.3)
  Top 0.254: IC104.1 113.98,47.94 114.94,48.9 v114.94,69.53
  Bottom 0.254: v114.94,69.53 122.56,69.53 123.83,70.8 IC103.13
GND  (via drill 0.3)
  Top 1.016: SLOT101.A21 SLOT101.A22 6.99,68.26 7.62,68.9 v7.62,80.33 | SLOT201.A21 SLOT201.A22 25.08,68.26 25.72,68.9 v25.72,80.33 | SLOT202.A21 SLOT202.A22 49.53,68.26 50.16,68.9 v50.16,80.33 | SLOT203.A21 SLOT203.A22 73.98,68.26 74.61,68.9 v74.61,80.33 | SLOT204.A21 SLOT204.A22 98.42,68.26 99.06,68.9 v99.06,80.33
  Bottom 1.016: v99.06,80.33 v74.61,80.33 v50.16,80.33 v25.72,80.33 v7.62,80.33 | X101.S1 111.12,10.16 | 111.12,10.16 X101.S2 116.84,10.16 119.7,13.02 120.33,13.02 123.83,16.51 135.25,16.51 136.08,17.34 C101.- 137.16,21.08 | X101.4 111.11,10.18 111.12,10.16
  pour Bottom: 0.32,99.69 0.32,0 139.7,0 139.7,99.69
HA  (via drill 0.3)
  Top 0.254: IC102.8 127.95,48.26 125.73,50.48 v125.73,66.99
  Bottom 0.254: v125.73,66.99 132.08,66.99 133.35,68.26 IC103.7
LA  (via drill 0.3)
  Top 0.254: IC101.8 v116.84,64.45
  Bottom 0.254: v116.84,64.45 132.4,64.45 133.67,65.72 IC103.6
N$1  (via drill 0.3)
  Top 0.406: v10.48,73.34 10.48,89.85 v12.7,92.08
  Top 1.016: SLOT101.A23 SLOT101.A24
  Bottom 0.406: SLOT101.A24 v10.48,73.34 | v12.7,92.08 28.57,92.08 30.48,93.98 47.31,93.98 49.85,91.44 53.66,91.44 56.2,93.98 71.44,93.98 74.3,91.12 77.15,91.12 80.33,94.3 95.25,94.3 97.79,91.76 101.6,91.76 106.36,96.52 119.38,96.52 121.28,98.42 124.46,98.42 125.73,97.16 LED101.A
N$2
  Bottom 1.016: X101.1 119.01,14.87 R107.2
N$3
  Top 1.016: SLOT101.B22 SLOT101.B23
N$4
  Top 0.813: R205.S 32.7,88.27 30.16,85.72 R205.A
  Bottom 0.813: R201.2 R205.A
N$9
  Top 0.813: R206.S 57.15,88.27 54.61,85.72 R206.A
  Bottom 0.813: R202.2 R206.A
N$10
  Top 0.813: R207.S 81.6,88.27 79.06,85.72 R207.A
  Bottom 0.813: R203.2 R207.A
N$15
  Top 0.813: R208.S 105.73,88.27 103.19,85.72 R208.A
  Bottom 0.813: R204.2 R208.A
SDA
  Top 0.813: R201.1 26.35,88.27 21.91,83.82 SLOT201.A25
SDB
  Top 0.813: R202.1 50.8,88.27 46.35,83.82 SLOT202.A25
SDC
  Top 0.813: R203.1 75.25,88.27 70.8,83.82 SLOT203.A25
SDD
  Top 0.813: R204.1 99.38,87.95 95.25,83.82 SLOT204.A25
SDIN
  Bottom 0.813: R208.E R207.E R206.E R205.E 13.65,96.52 5.71,88.58 SLOT101.A25
V+
  Bottom 1.016: SW101.2 126.36,12.06 R107.1

### Text on the board
tNames: MSX | EXP | (c) 2019-2023 by Dr.-Ing. Th. Wiesner | 22.01.2024 | msx_slot_expander.brd